# EAGLE schematic FRIDAY_Left_SCH4b (EAGLE 9.6.2)

## Sheet 1 of 5
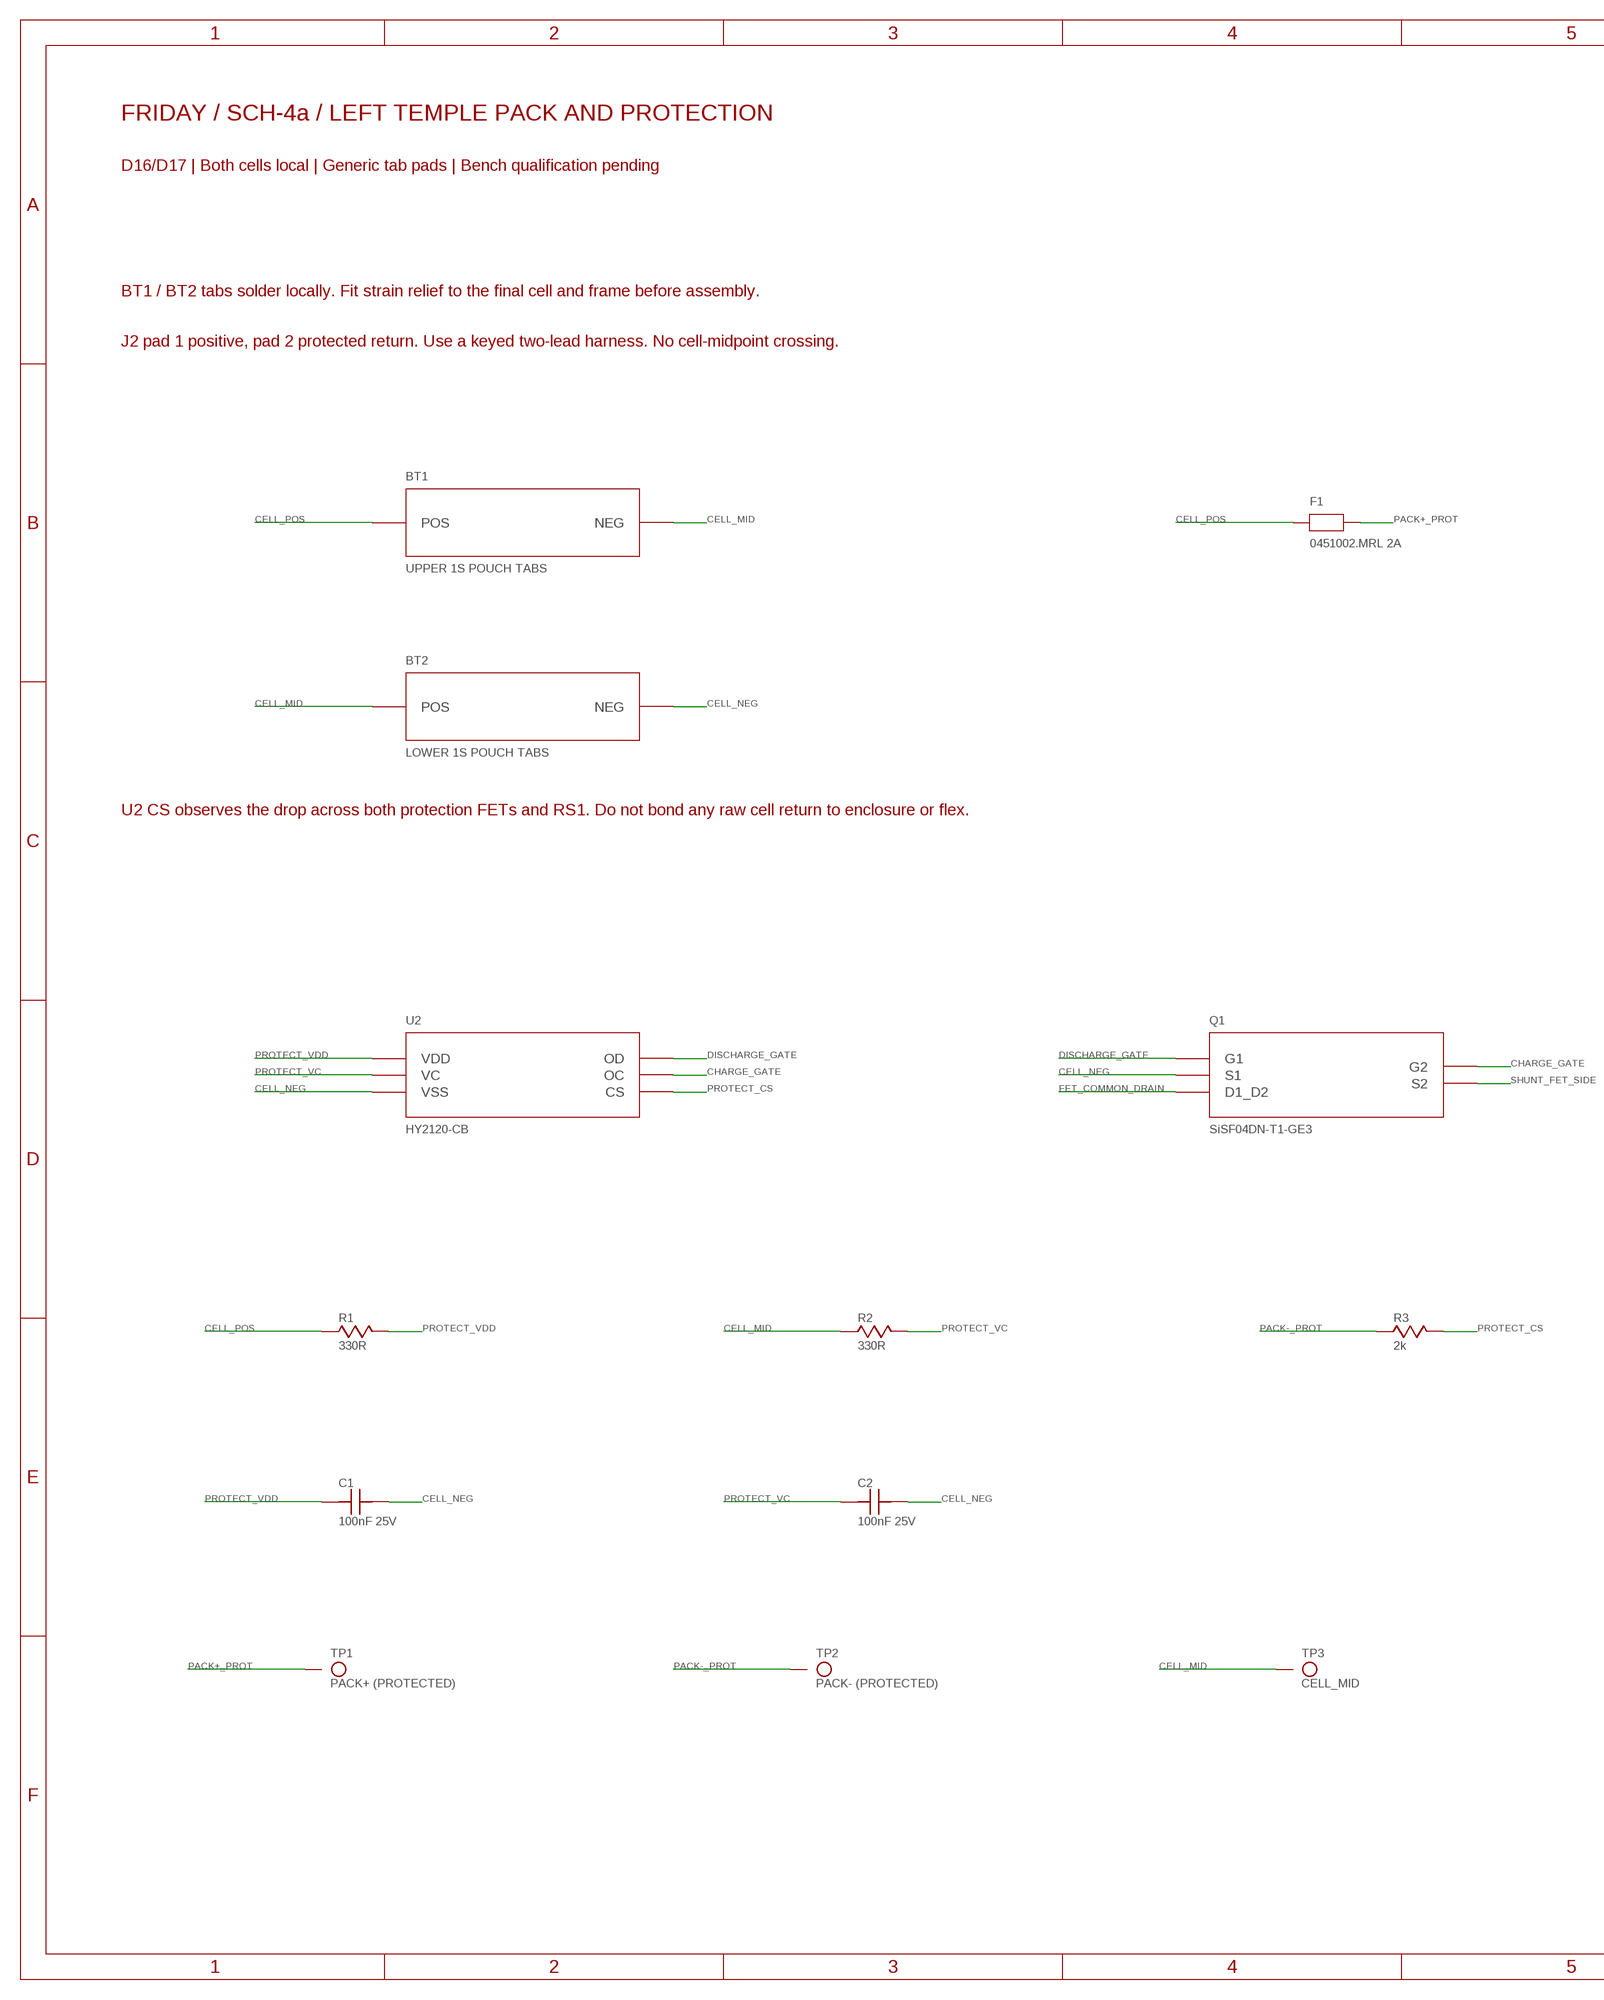
[diagram p0: schematic, sheet 1, part 1 of 2]
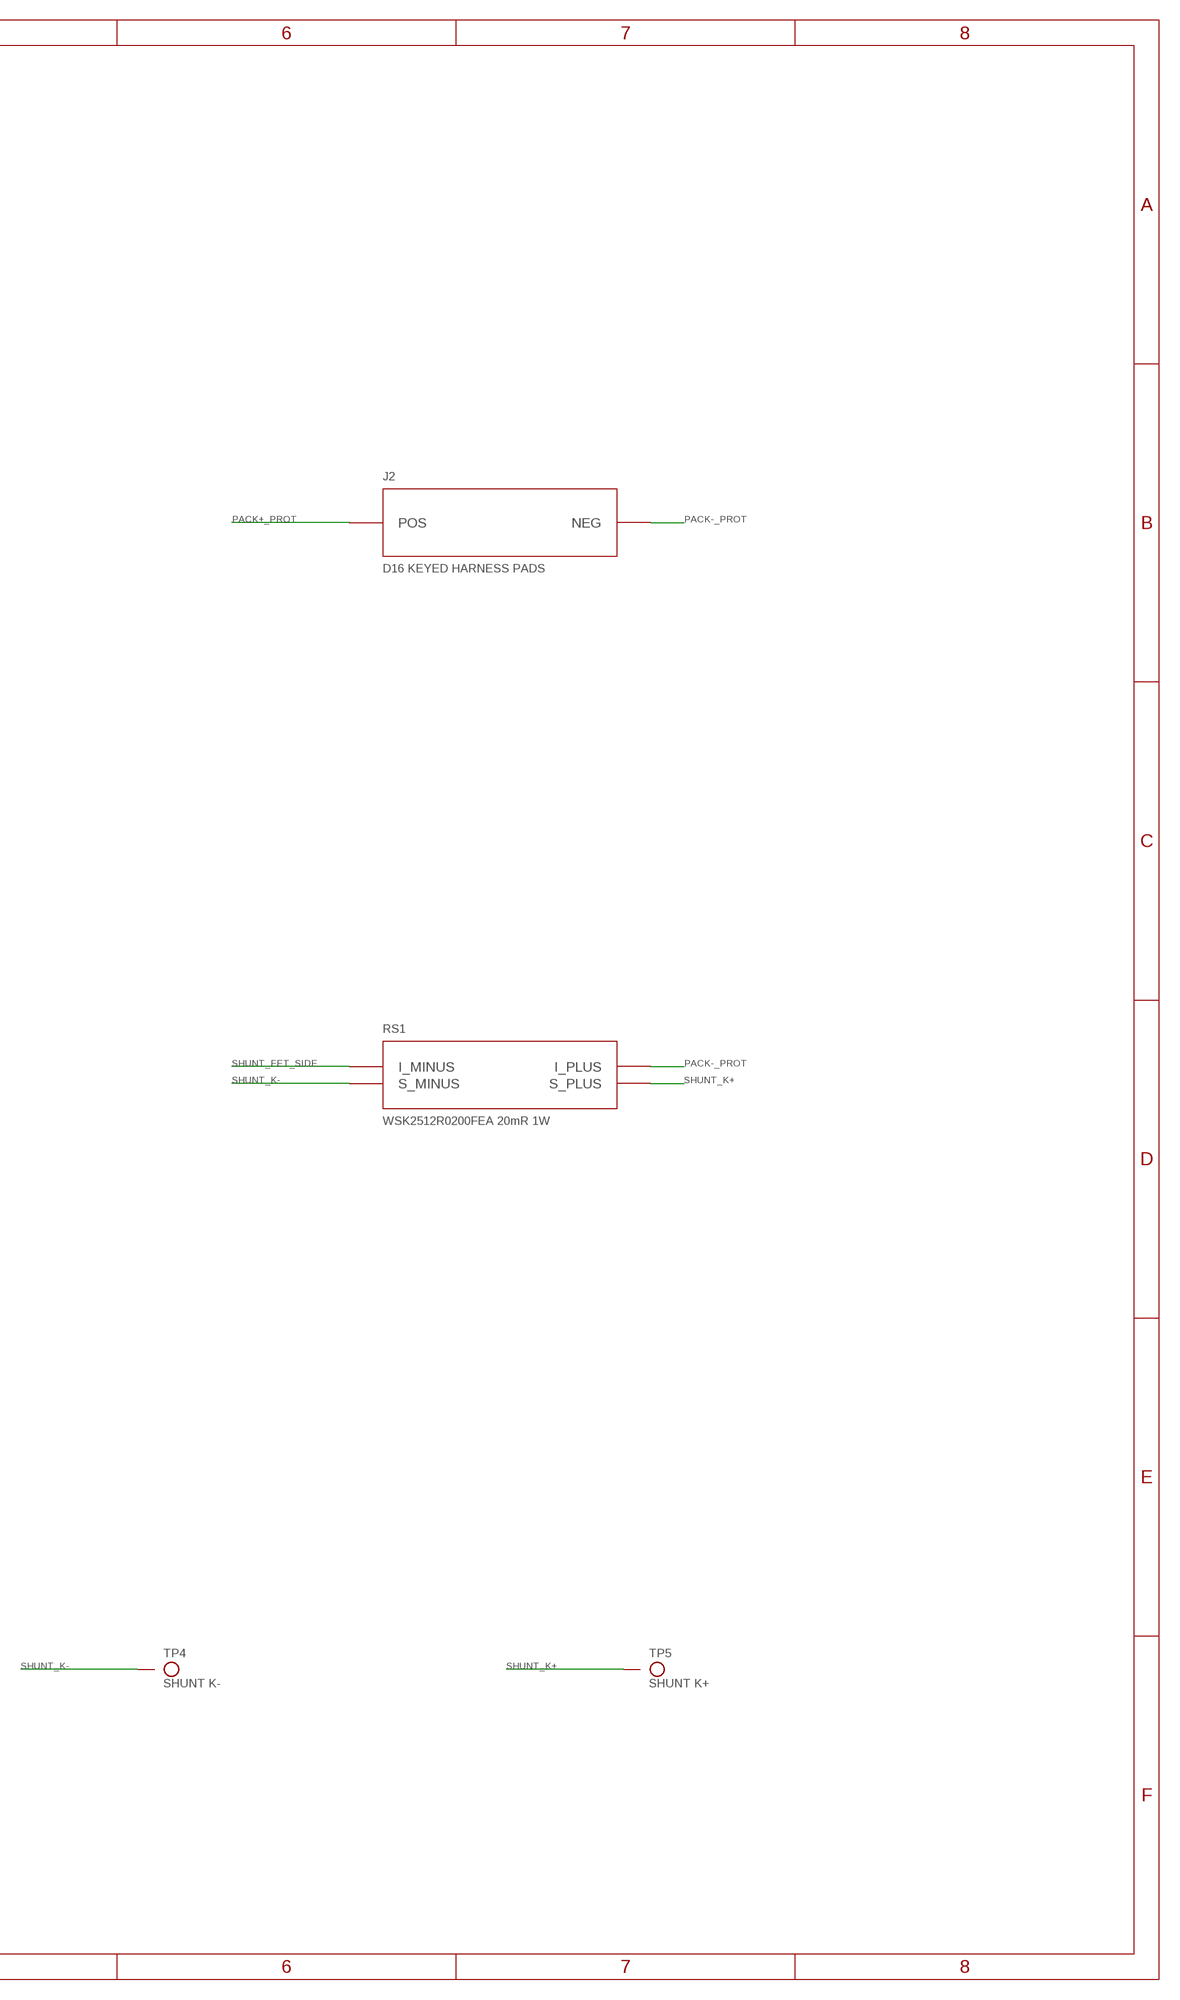
[diagram p1: schematic, sheet 1, part 2 of 2]

### Parts
BT1  UPPER 1S POUCH TABS  CELL_TABS  [CELL_TABS]
BT2  LOWER 1S POUCH TABS  CELL_TABS  [CELL_TABS]
C1  100nF 25V  C_0603  [C0603]
C2  100nF 25V  C_0603  [C0603]
F1  0451002.MRL 2A  NANO2_FUSE  [NANO2_2410]
J2  D16 KEYED HARNESS PADS  HARNESS_PADS  [HARNESS_PADS]
Q1  SiSF04DN-T1-GE3  SISF04DN  [POWERPAK_1212_8SCD]
R1  330R  R_0603  [R0603]
R2  330R  R_0603  [R0603]
R3  2k  R_0603  [R0603]
RS1  WSK2512R0200FEA 20mR 1W  WSK2512  [VISHAY_WSK2512]
TP1  PACK+ (PROTECTED)  TP_1MM  [TP_1MM]
TP2  PACK- (PROTECTED)  TP_1MM  [TP_1MM]
TP3  CELL_MID  TP_1MM  [TP_1MM]
TP4  SHUNT K-  TP_1MM  [TP_1MM]
TP5  SHUNT K+  TP_1MM  [TP_1MM]
U2  HY2120-CB  HY2120_CB  [SOT23_6]

### Nets
CELL_MID: BT1.2(NEG) BT2.1(POS) R2.1 TP3.1 ; also sheet 2
CELL_NEG: BT2.2(NEG) C1.2 C2.2 Q1.S1_78(S1) U2.6(VSS)
CELL_POS: BT1.1(POS) F1.1 R1.1
CHARGE_GATE: Q1.4(G2) U2.2(OC)
DISCHARGE_GATE: Q1.1(G1) U2.1(OD)
FET_COMMON_DRAIN: Q1.2(D1_D2) Q1.3(D1_D2)
PACK+_PROT: F1.2 J2.1(POS) TP1.1 ; also sheet 2
PACK-_PROT: J2.2(NEG) R3.1 RS1.P2(I_PLUS) TP2.1 ; also sheet 2,3,4,5
PROTECT_CS: R3.2 U2.3(CS)
PROTECT_VC: C2.1 R2.2 U2.4(VC)
PROTECT_VDD: C1.1 R1.2 U2.5(VDD)
SHUNT_FET_SIDE: Q1.S2_56(S2) RS1.P1(I_MINUS)
SHUNT_K+: RS1.K2(S_PLUS) TP5.1
SHUNT_K-: RS1.K1(S_MINUS) TP4.1

### Notes on the sheet
- FRIDAY / SCH-4a / LEFT TEMPLE PACK AND PROTECTION
- D16/D17 | Both cells local | Generic tab pads | Bench qualification pending
- BT1 / BT2 tabs solder locally. Fit strain relief to the final cell and frame before assembly.
- J2 pad 1 positive, pad 2 protected return. Use a keyed two-lead harness. No cell-midpoint crossing.
- U2 CS observes the drop across both protection FETs and RS1. Do not bond any raw cell return to enclosure or flex.

## Sheet 2 of 5
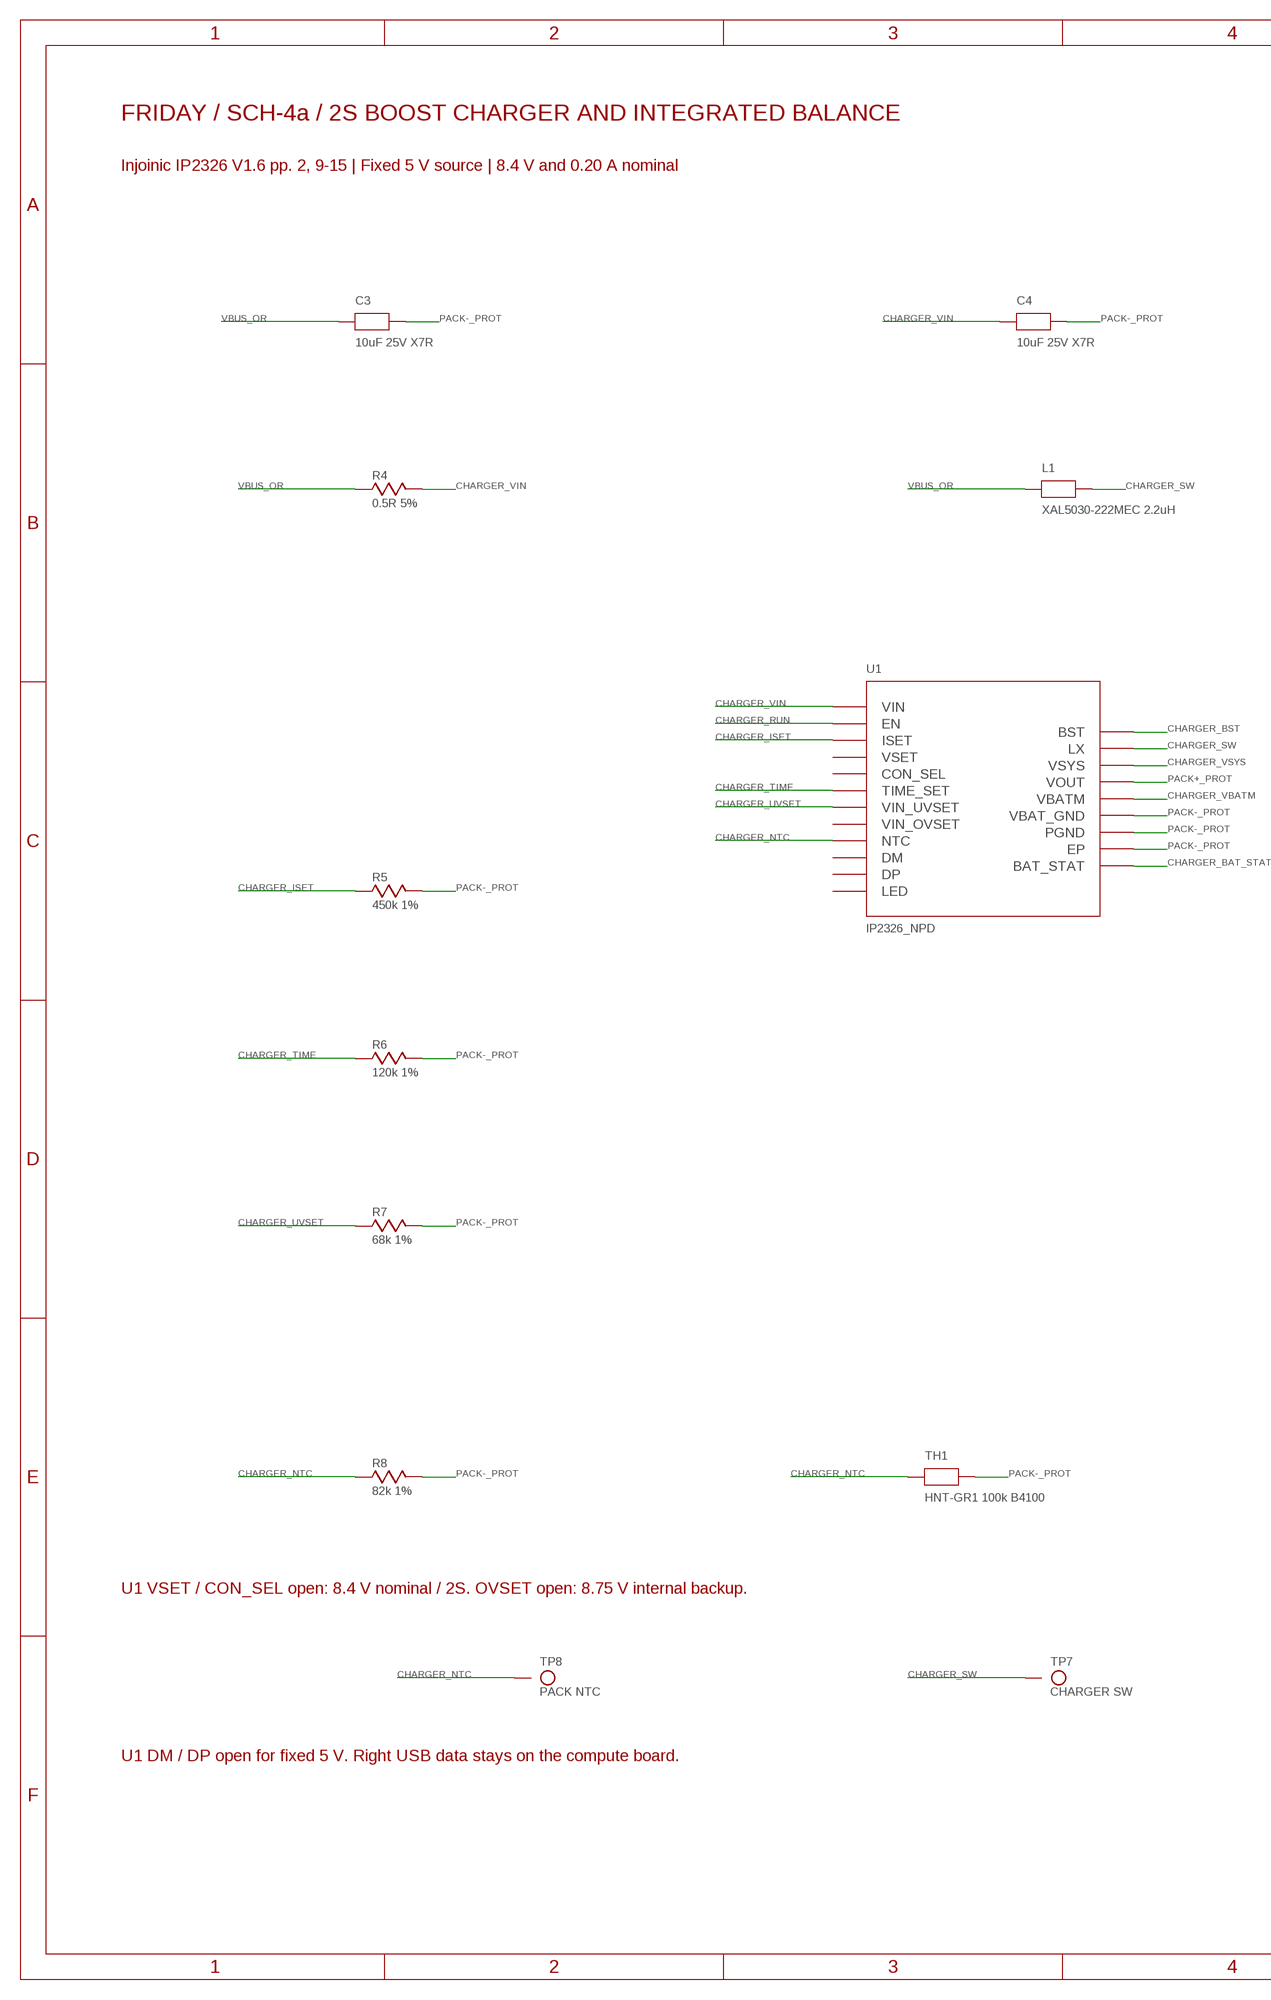
[diagram p2: schematic, sheet 2, part 1 of 2]
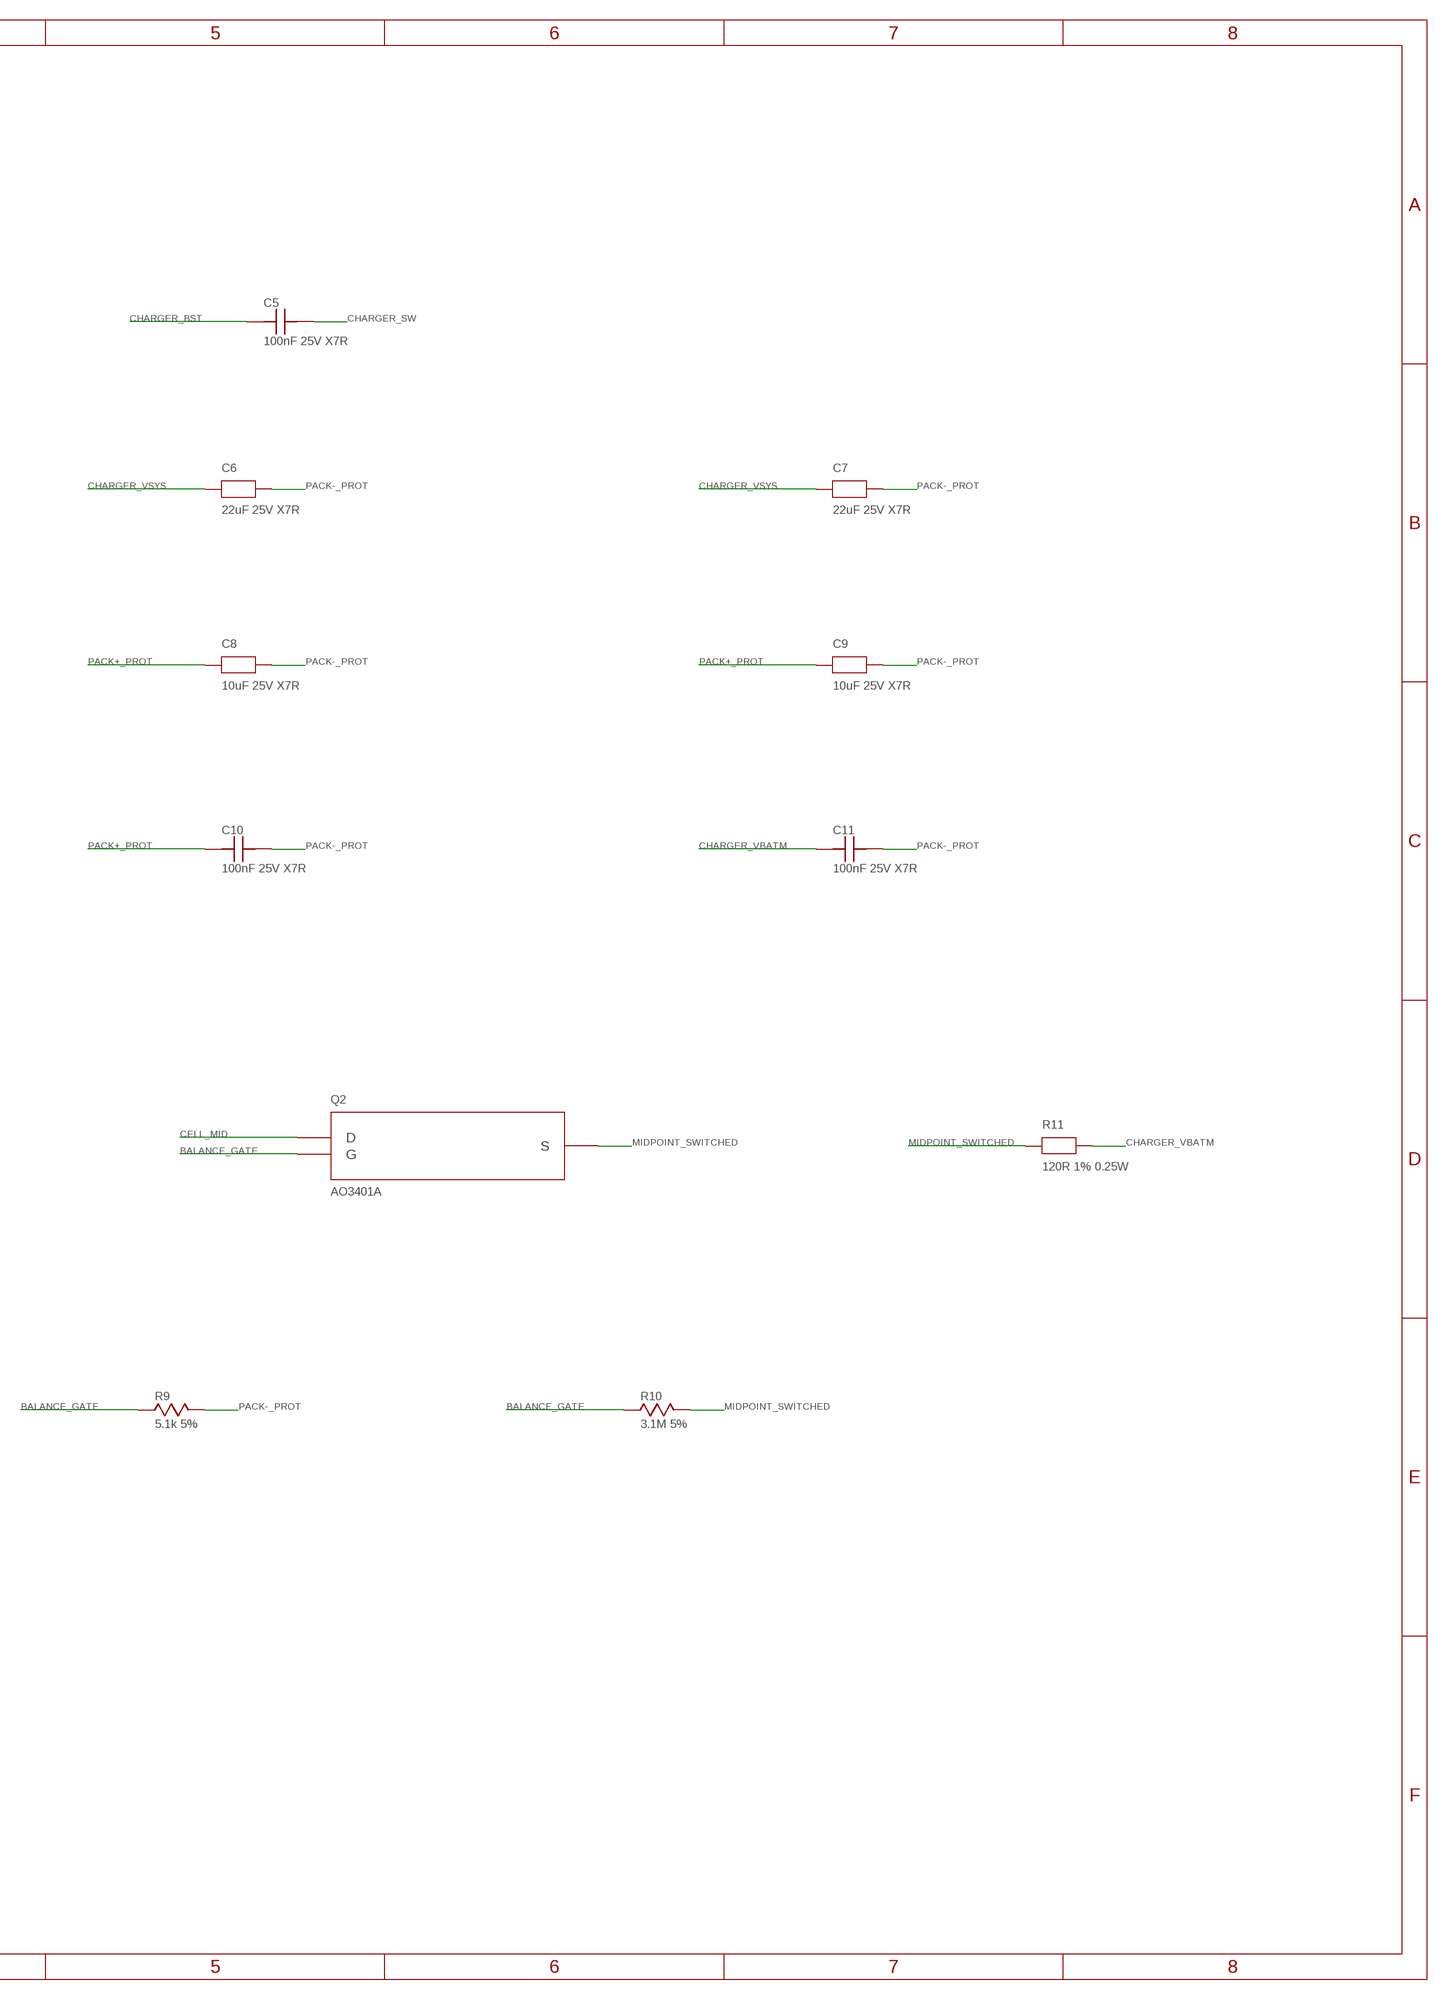
[diagram p3: schematic, sheet 2, part 2 of 2]

### Parts
C3  10uF 25V X7R  C_1206  [C_1206]
C4  10uF 25V X7R  C_1206  [C_1206]
C5  100nF 25V X7R  C_0603  [C0603]
C6  22uF 25V X7R  C_1206  [C_1206]
C7  22uF 25V X7R  C_1206  [C_1206]
C8  10uF 25V X7R  C_1206  [C_1206]
C9  10uF 25V X7R  C_1206  [C_1206]
C10  100nF 25V X7R  C_0603  [C0603]
C11  100nF 25V X7R  C_0603  [C0603]
L1  XAL5030-222MEC 2.2uH  INDUCTOR  [XAL5030]
Q2  AO3401A  [SOT23_3]
R4  0.5R 5%  R_0603  [R0603]
R5  450k 1%  R_0603  [R0603]
R6  120k 1%  R_0603  [R0603]
R7  68k 1%  R_0603  [R0603]
R8  82k 1%  R_0603  [R0603]
R9  5.1k 5%  R_0603  [R0603]
R10  3.1M 5%  R_0603  [R0603]
R11  120R 1% 0.25W  R_1206  [C_1206]
TH1  HNT-GR1 100k B4100  PACK_NTC  [NTC_PADS]
TP7  CHARGER SW  TP_1MM  [TP_1MM]
TP8  PACK NTC  TP_1MM  [TP_1MM]
U1  IP2326_NPD  [QFN24_4X4_EP]

### Nets
BALANCE_GATE: Q2.1(G) R9.1 R10.1
CELL_MID: Q2.3(D) ; also sheet 1
CHARGER_BAT_STAT: U1.5(BAT_STAT) ; also sheet 4
CHARGER_BST: C5.1 U1.14(BST)
CHARGER_ISET: R5.1 U1.11(ISET)
CHARGER_NTC: R8.1 TH1.1 TP8.1 U1.4(NTC)
CHARGER_RUN: U1.12(EN) ; also sheet 4
CHARGER_SW: C5.2 L1.2 TP7.1 U1.15(LX) U1.16(LX) U1.17(LX)
CHARGER_TIME: R6.1 U1.7(TIME_SET)
CHARGER_UVSET: R7.1 U1.8(VIN_UVSET)
CHARGER_VBATM: C11.1 R11.2 U1.23(VBATM)
CHARGER_VIN: C4.1 R4.2 U1.13(VIN)
CHARGER_VSYS: C6.1 C7.1 U1.19(VSYS) U1.20(VSYS)
MIDPOINT_SWITCHED: Q2.2(S) R10.2 R11.1
PACK+_PROT: C8.1 C9.1 C10.1 U1.21(VOUT) U1.22(VOUT) ; also sheet 1
PACK-_PROT: C3.2 C4.2 C6.2 C7.2 C8.2 C9.2 C10.2 C11.2 R5.2 R6.2 R7.2 R8.2 R9.2 TH1.2 U1.18(PGND) U1.24(VBAT_GND) U1.EP ; also sheet 1,3,4,5
VBUS_OR: C3.1 L1.1 R4.1 ; also sheet 3,4
Unconnected: U1.1(DM) U1.2(DP) U1.3(VSET) U1.6(LED) U1.9(VIN_OVSET) U1.10(CON_SEL)

### Notes on the sheet
- FRIDAY / SCH-4a / 2S BOOST CHARGER AND INTEGRATED BALANCE
- Injoinic IP2326 V1.6 pp. 2, 9-15 | Fixed 5 V source | 8.4 V and 0.20 A nominal
- U1 VSET / CON_SEL open: 8.4 V nominal / 2S. OVSET open: 8.75 V internal backup.
- U1 DM / DP open for fixed 5 V. Right USB data stays on the compute board.

## Sheet 3 of 5
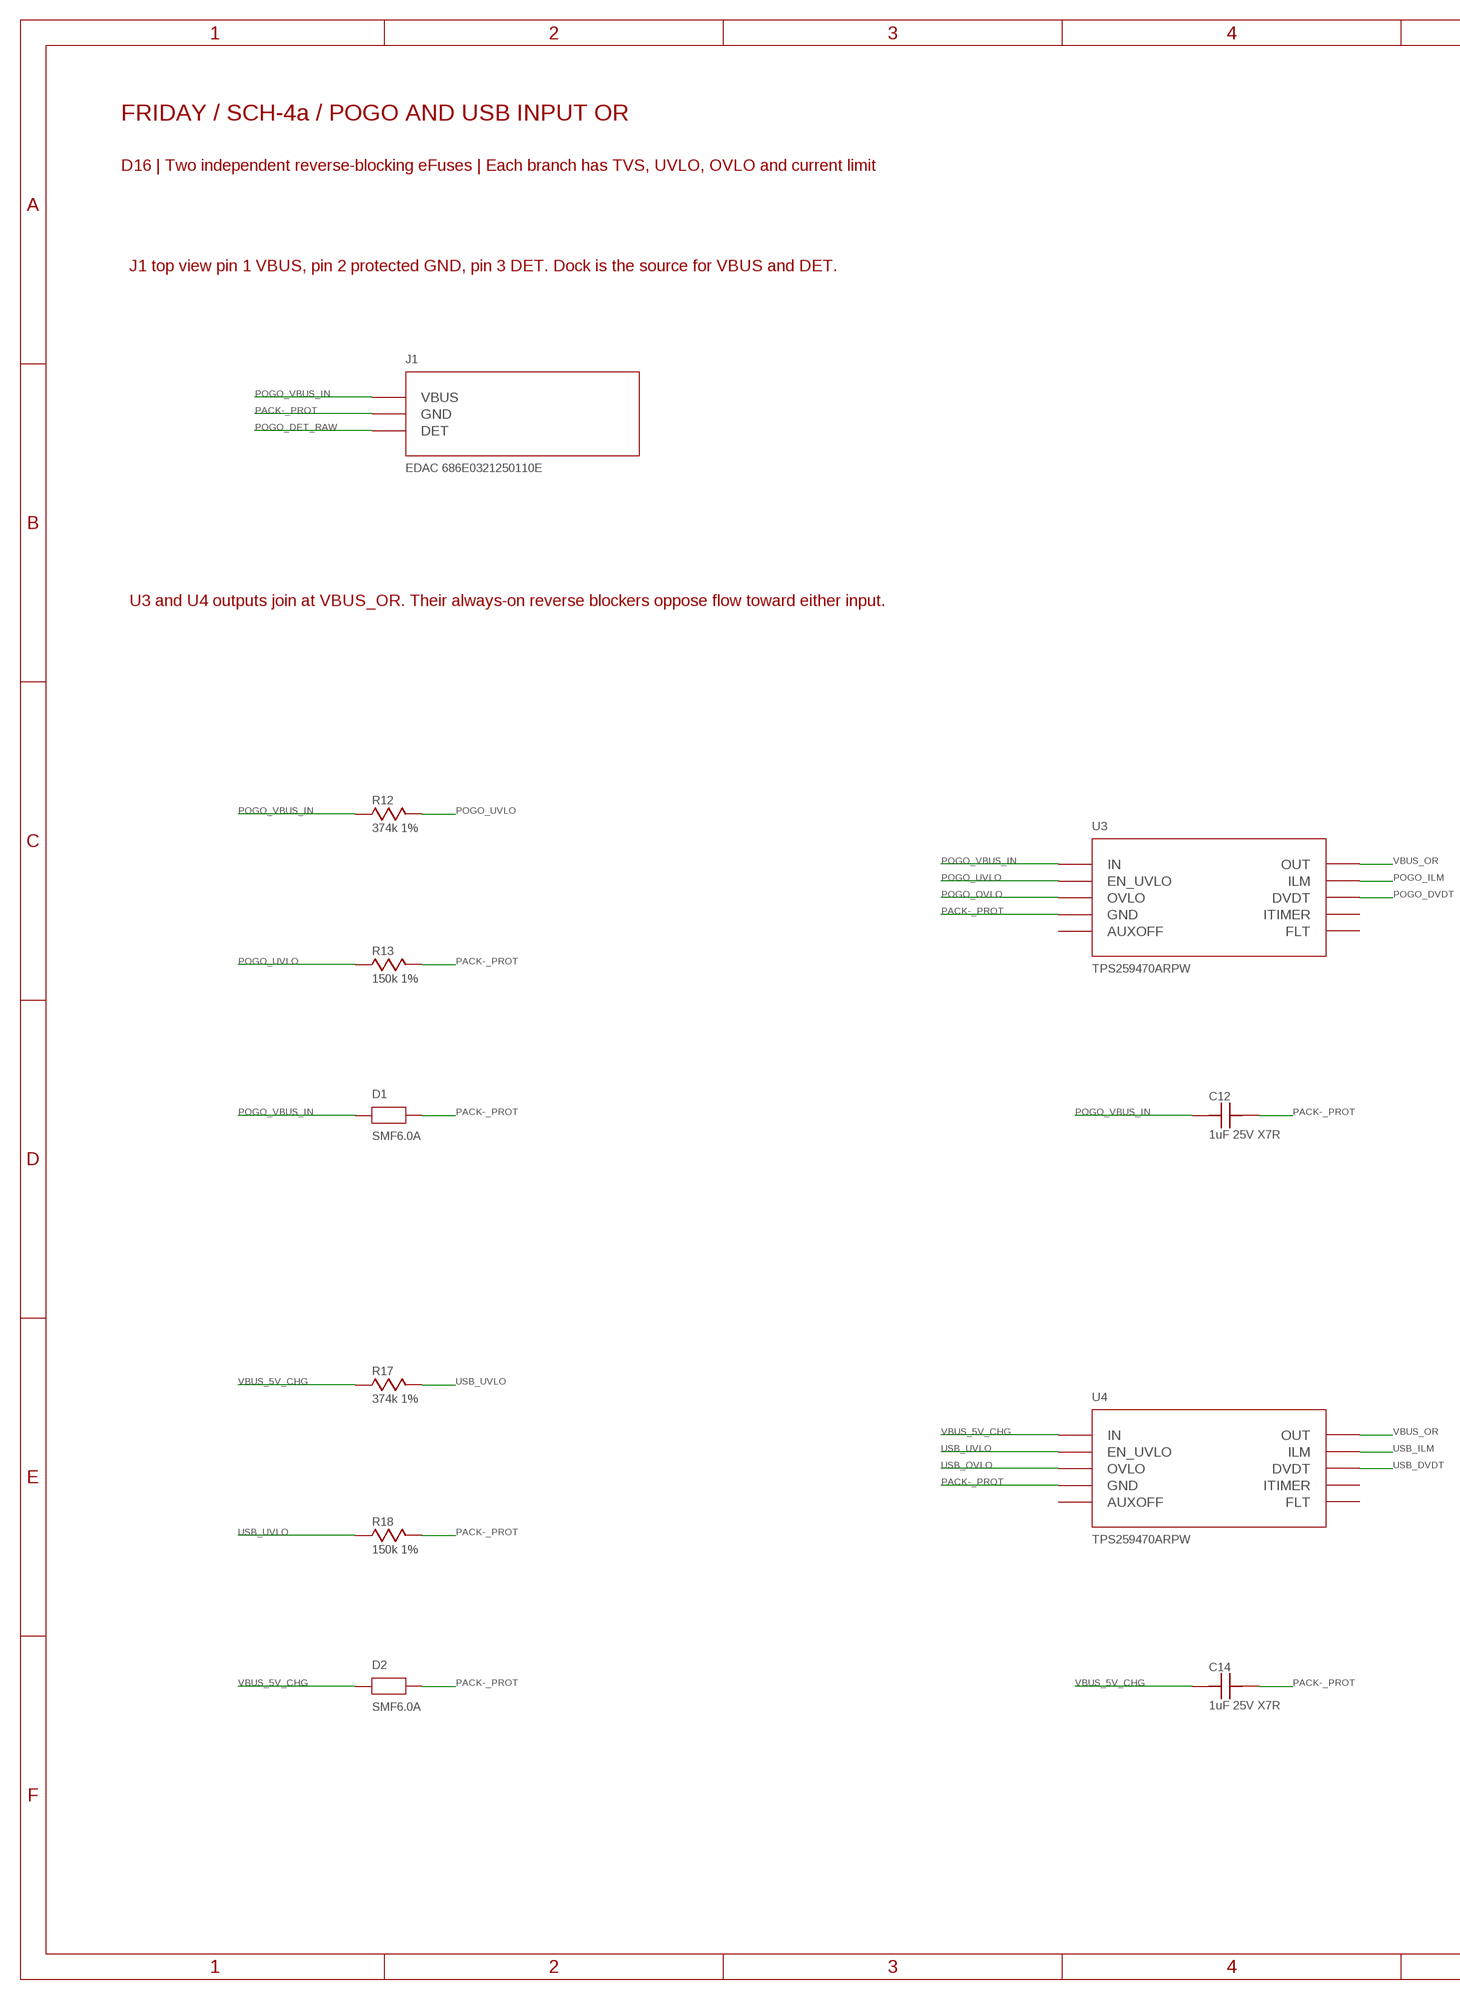
[diagram p4: schematic, sheet 3, part 1 of 2]
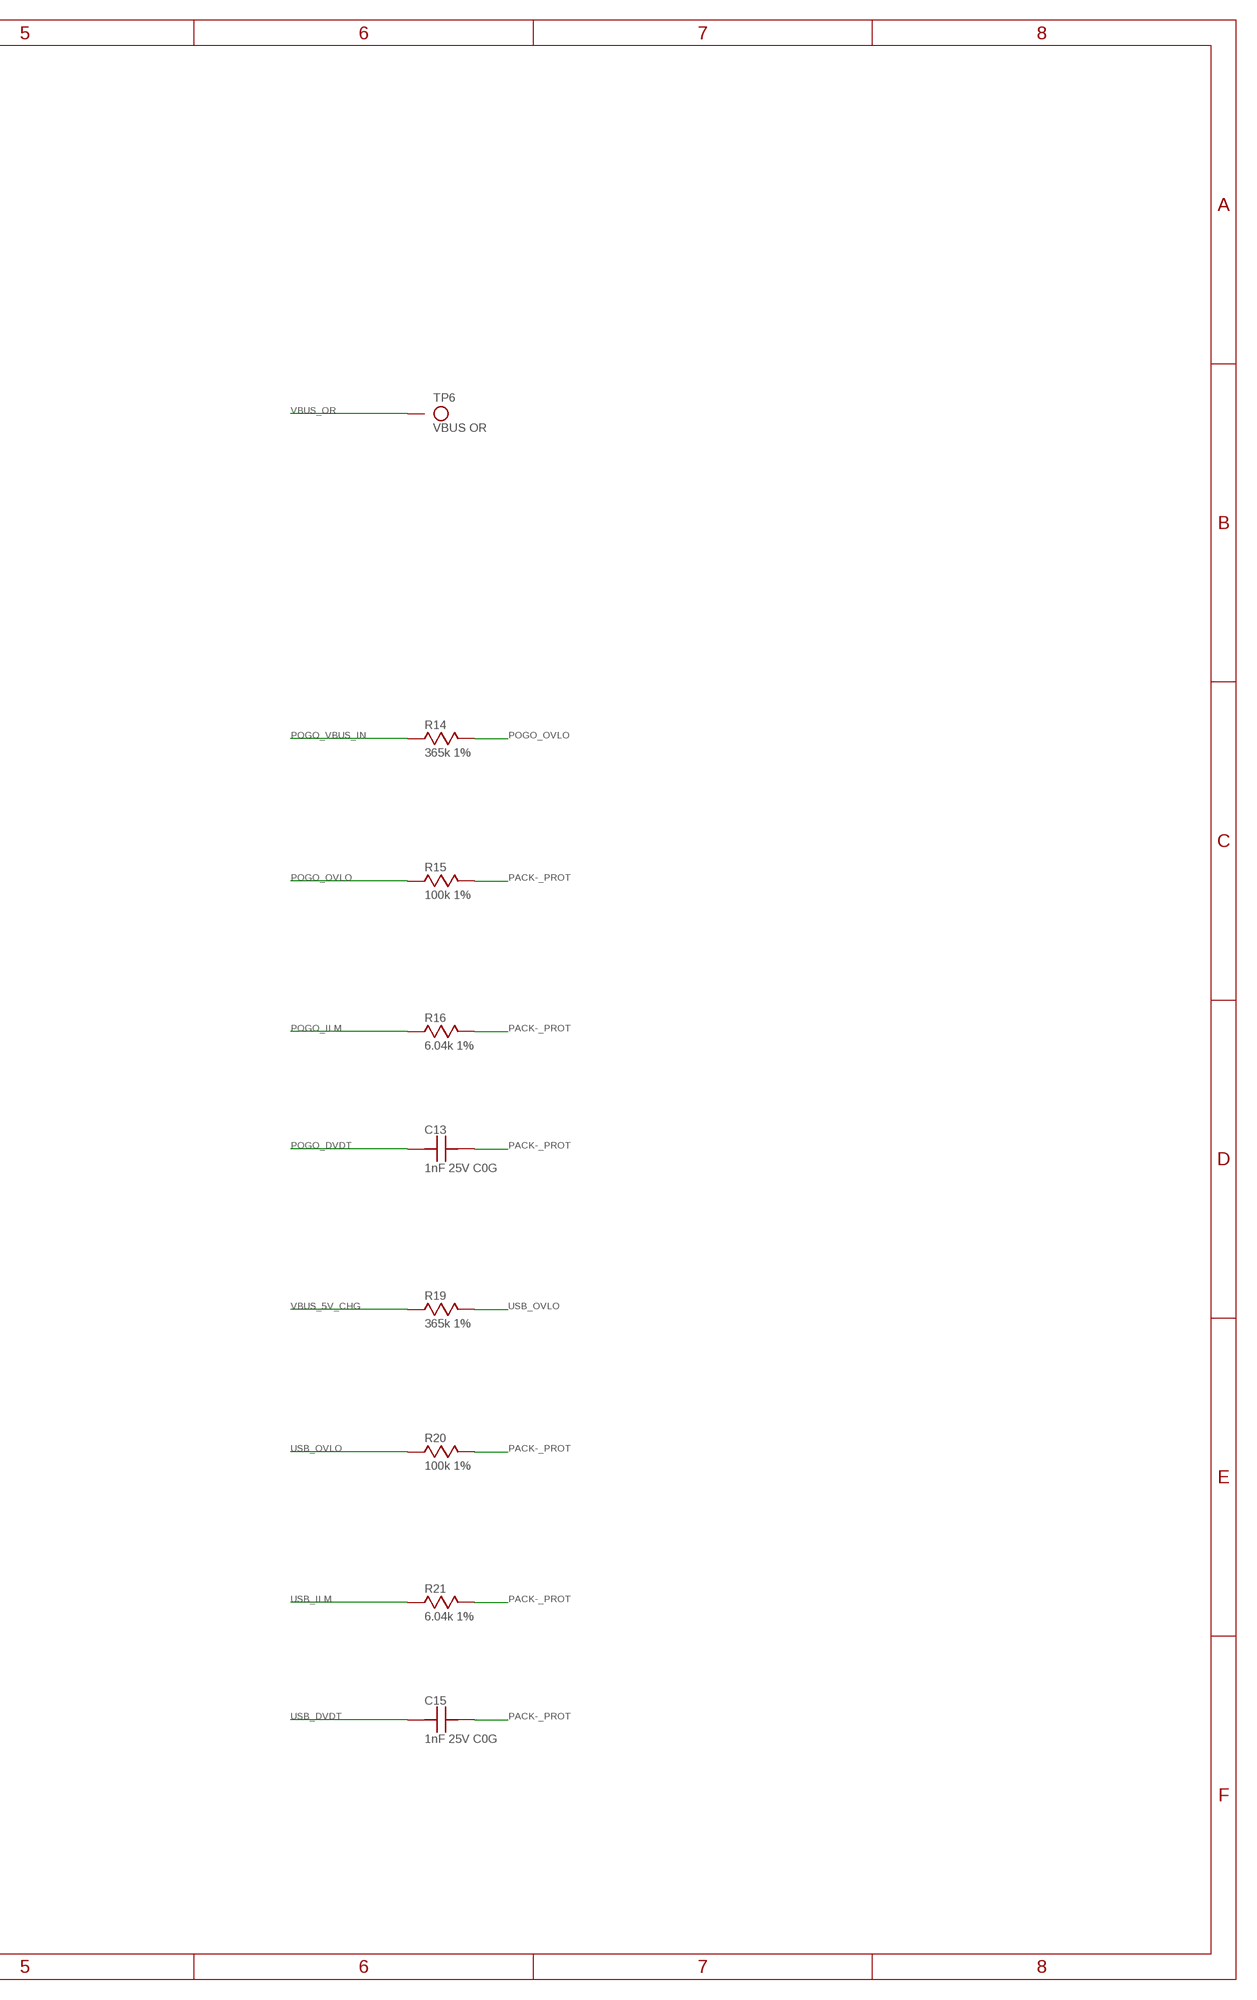
[diagram p5: schematic, sheet 3, part 2 of 2]

### Parts
C12  1uF 25V X7R  C_0603  [C0603]
C13  1nF 25V C0G  C_0603  [C0603]
C14  1uF 25V X7R  C_0603  [C0603]
C15  1nF 25V C0G  C_0603  [C0603]
D1  SMF6.0A  SMF_TVS  [SOD123FL]
D2  SMF6.0A  SMF_TVS  [SOD123FL]
J1  EDAC 686E0321250110E  MAGNETIC_POGO  [EDAC_MAGNETIC_3POS]
R12  374k 1%  R_0603  [R0603]
R13  150k 1%  R_0603  [R0603]
R14  365k 1%  R_0603  [R0603]
R15  100k 1%  R_0603  [R0603]
R16  6.04k 1%  R_0603  [R0603]
R17  374k 1%  R_0603  [R0603]
R18  150k 1%  R_0603  [R0603]
R19  365k 1%  R_0603  [R0603]
R20  100k 1%  R_0603  [R0603]
R21  6.04k 1%  R_0603  [R0603]
TP6  VBUS OR  TP_1MM  [TP_1MM]
U3  TPS259470ARPW  TPS259470  [TI_RPW0010A]
U4  TPS259470ARPW  TPS259470  [TI_RPW0010A]

### Nets
PACK-_PROT: C12.2 C13.2 C14.2 C15.2 D1.2(A) D2.2(A) J1.2(GND) R13.2 R15.2 R16.2 R18.2 R20.2 R21.2 U3.8(GND) U4.8(GND) ; also sheet 1,2,4,5
POGO_DET_RAW: J1.3(DET) ; also sheet 4
POGO_DVDT: C13.1 U3.7(DVDT)
POGO_ILM: R16.1 U3.9(ILM)
POGO_OVLO: R14.2 R15.1 U3.2(OVLO)
POGO_UVLO: R12.2 R13.1 U3.1(EN_UVLO)
POGO_VBUS_IN: C12.1 D1.1(K) J1.1(VBUS) R12.1 R14.1 U3.5(IN)
USB_DVDT: C15.1 U4.7(DVDT)
USB_ILM: R21.1 U4.9(ILM)
USB_OVLO: R19.2 R20.1 U4.2(OVLO)
USB_UVLO: R17.2 R18.1 U4.1(EN_UVLO)
VBUS_5V_CHG: C14.1 D2.1(K) R17.1 R19.1 U4.5(IN) ; also sheet 4
VBUS_OR: TP6.1 U3.6(OUT) U4.6(OUT) ; also sheet 2,4
Unconnected: U3.3(AUXOFF) U3.4(FLT) U3.10(ITIMER) U4.3(AUXOFF) U4.4(FLT) U4.10(ITIMER)

### Notes on the sheet
- FRIDAY / SCH-4a / POGO AND USB INPUT OR
- D16 | Two independent reverse-blocking eFuses | Each branch has TVS, UVLO, OVLO and current limit
- J1 top view pin 1 VBUS, pin 2 protected GND, pin 3 DET. Dock is the source for VBUS and DET.
- U3 and U4 outputs join at VBUS_OR. Their always-on reverse blockers oppose flow toward either input.

## Sheet 4 of 5
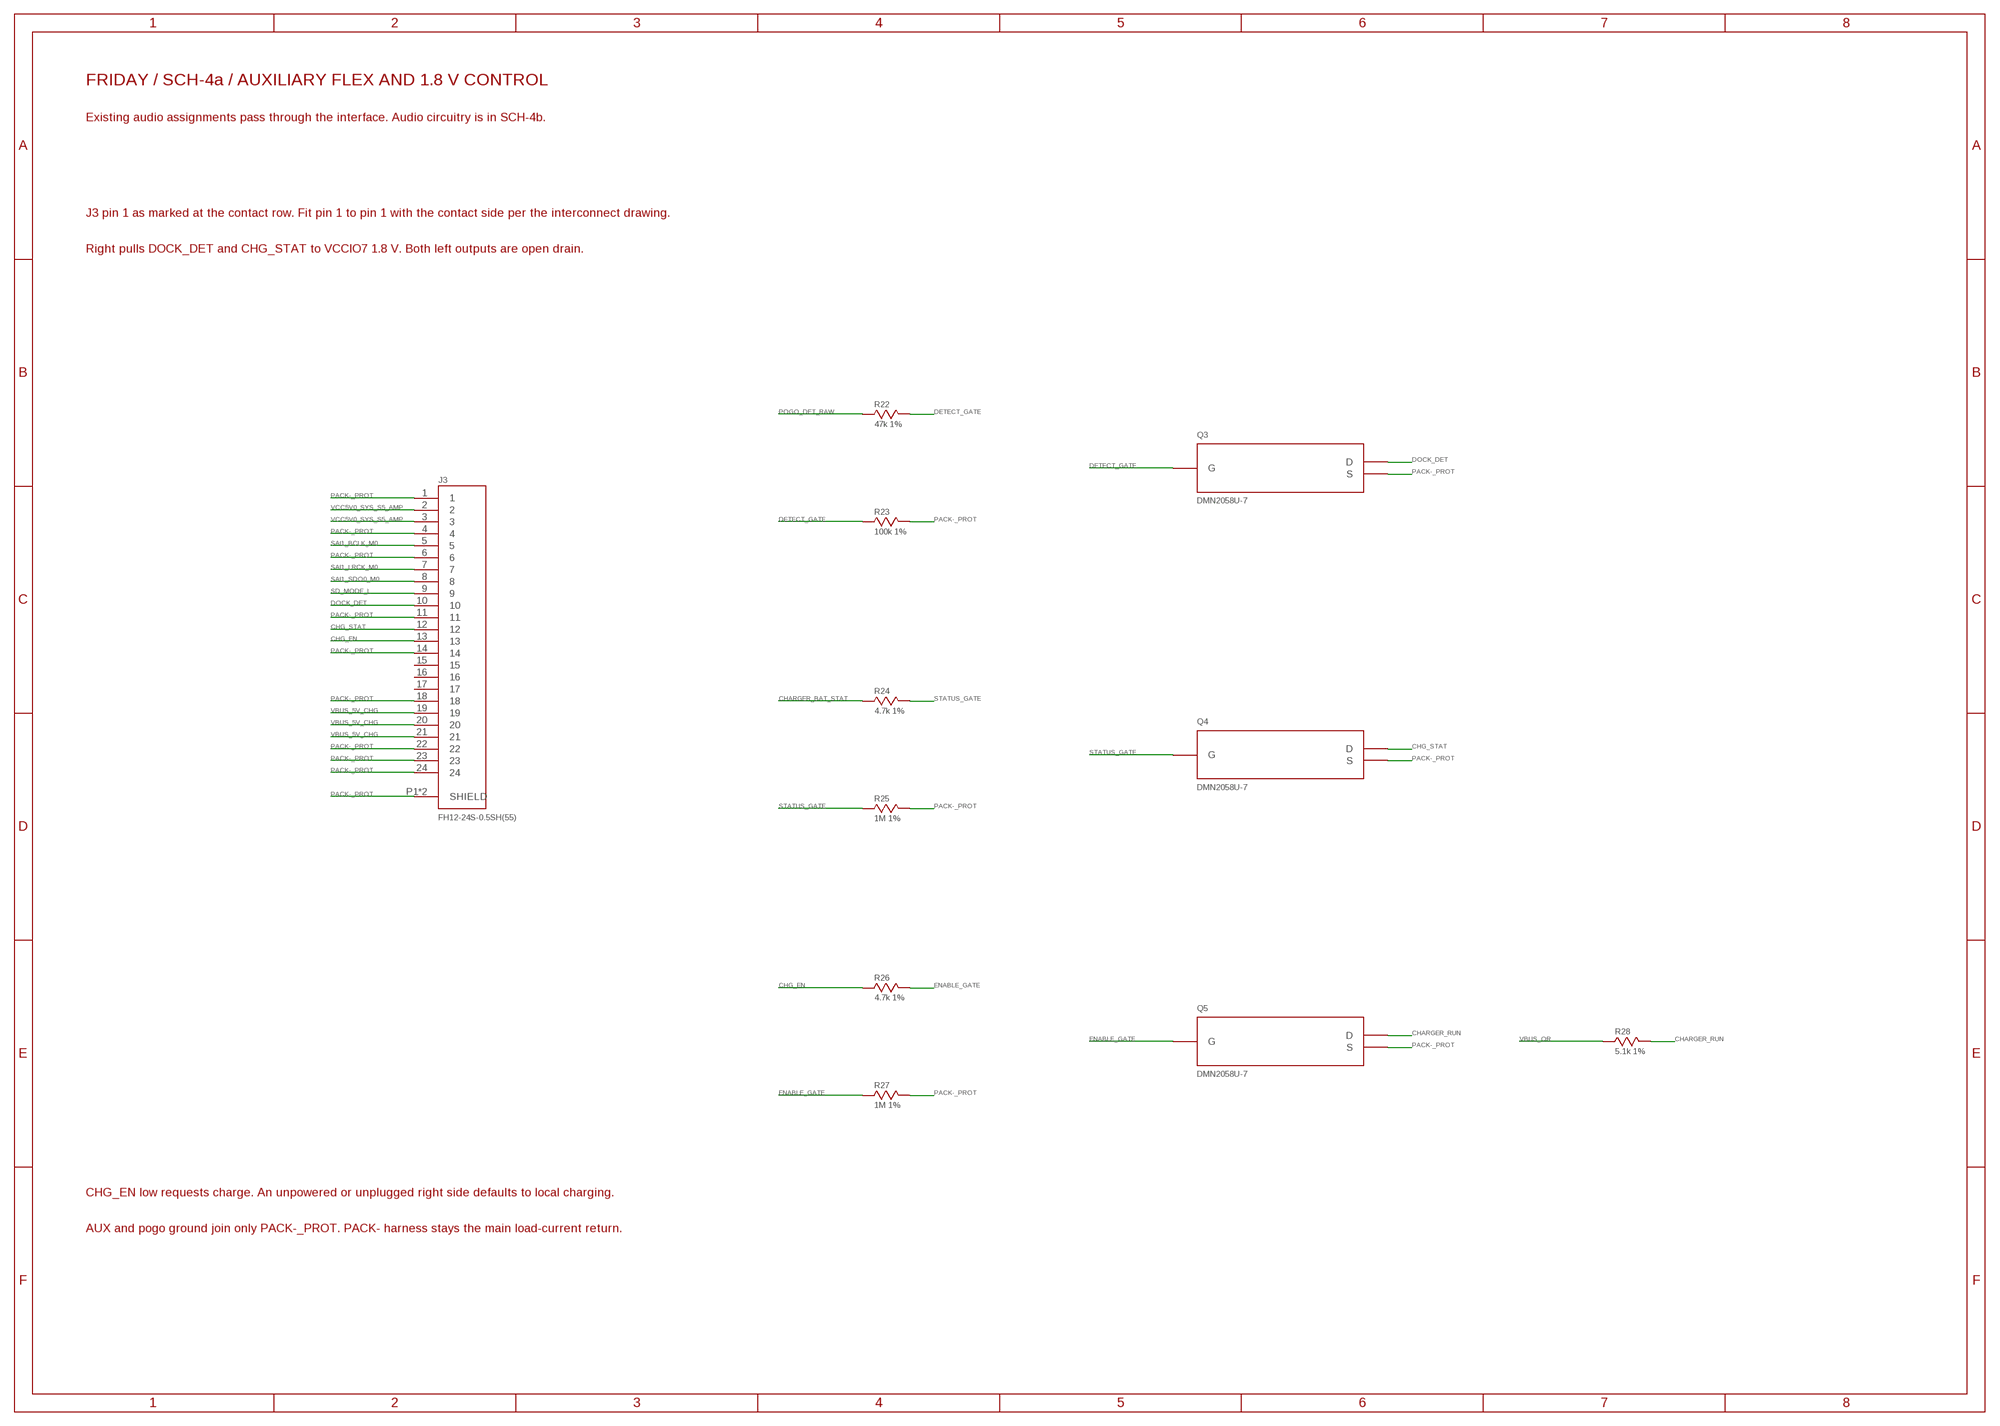
[diagram p6: schematic, sheet 4]

### Parts
J3  FH12-24S-0.5SH(55)  [HRS_FH12-24S-0.5SH(55)]
Q3  DMN2058U-7  DMN2058U  [DIODES_SOT23]
Q4  DMN2058U-7  DMN2058U  [DIODES_SOT23]
Q5  DMN2058U-7  DMN2058U  [DIODES_SOT23]
R22  47k 1%  R_0603  [R0603]
R23  100k 1%  R_0603  [R0603]
R24  4.7k 1%  R_0603  [R0603]
R25  1M 1%  R_0603  [R0603]
R26  4.7k 1%  R_0603  [R0603]
R27  1M 1%  R_0603  [R0603]
R28  5.1k 1%  R_0603  [R0603]

### Nets
CHARGER_BAT_STAT: R24.1 ; also sheet 2
CHARGER_RUN: Q5.3(D) R28.2 ; also sheet 2
CHG_EN: J3.13 R26.1
CHG_STAT: J3.12 Q4.3(D)
DETECT_GATE: Q3.1(G) R22.2 R23.1
DOCK_DET: J3.10 Q3.3(D)
ENABLE_GATE: Q5.1(G) R26.2 R27.1
PACK-_PROT: J3.1 J3.4 J3.6 J3.11 J3.14 J3.18 J3.22 J3.23 J3.24 J3.P1(SHIELD) J3.P2(SHIELD) Q3.2(S) Q4.2(S) Q5.2(S) R23.2 R25.2 R27.2 ; also sheet 1,2,3,5
POGO_DET_RAW: R22.1 ; also sheet 3
SAI1_BCLK_M0: J3.5 ; also sheet 5
SAI1_LRCK_M0: J3.7 ; also sheet 5
SAI1_SDO0_M0: J3.8 ; also sheet 5
SD_MODE_L: J3.9 ; also sheet 5
STATUS_GATE: Q4.1(G) R24.2 R25.1
VBUS_5V_CHG: J3.19 J3.20 J3.21 ; also sheet 3
VBUS_OR: R28.1 ; also sheet 2,3
VCC5V0_SYS_S5_AMP: J3.2 J3.3 ; also sheet 5
Unconnected: J3.15 J3.16 J3.17

### Notes on the sheet
- FRIDAY / SCH-4a / AUXILIARY FLEX AND 1.8 V CONTROL
- Existing audio assignments pass through the interface. Audio circuitry is in SCH-4b.
- J3 pin 1 as marked at the contact row. Fit pin 1 to pin 1 with the contact side per the interconnect drawing.
- Right pulls DOCK_DET and CHG_STAT to VCCIO7 1.8 V. Both left outputs are open drain.
- CHG_EN low requests charge. An unpowered or unplugged right side defaults to local charging.
- AUX and pogo ground join only PACK-_PROT. PACK- harness stays the main load-current return.

## Sheet 5 of 5
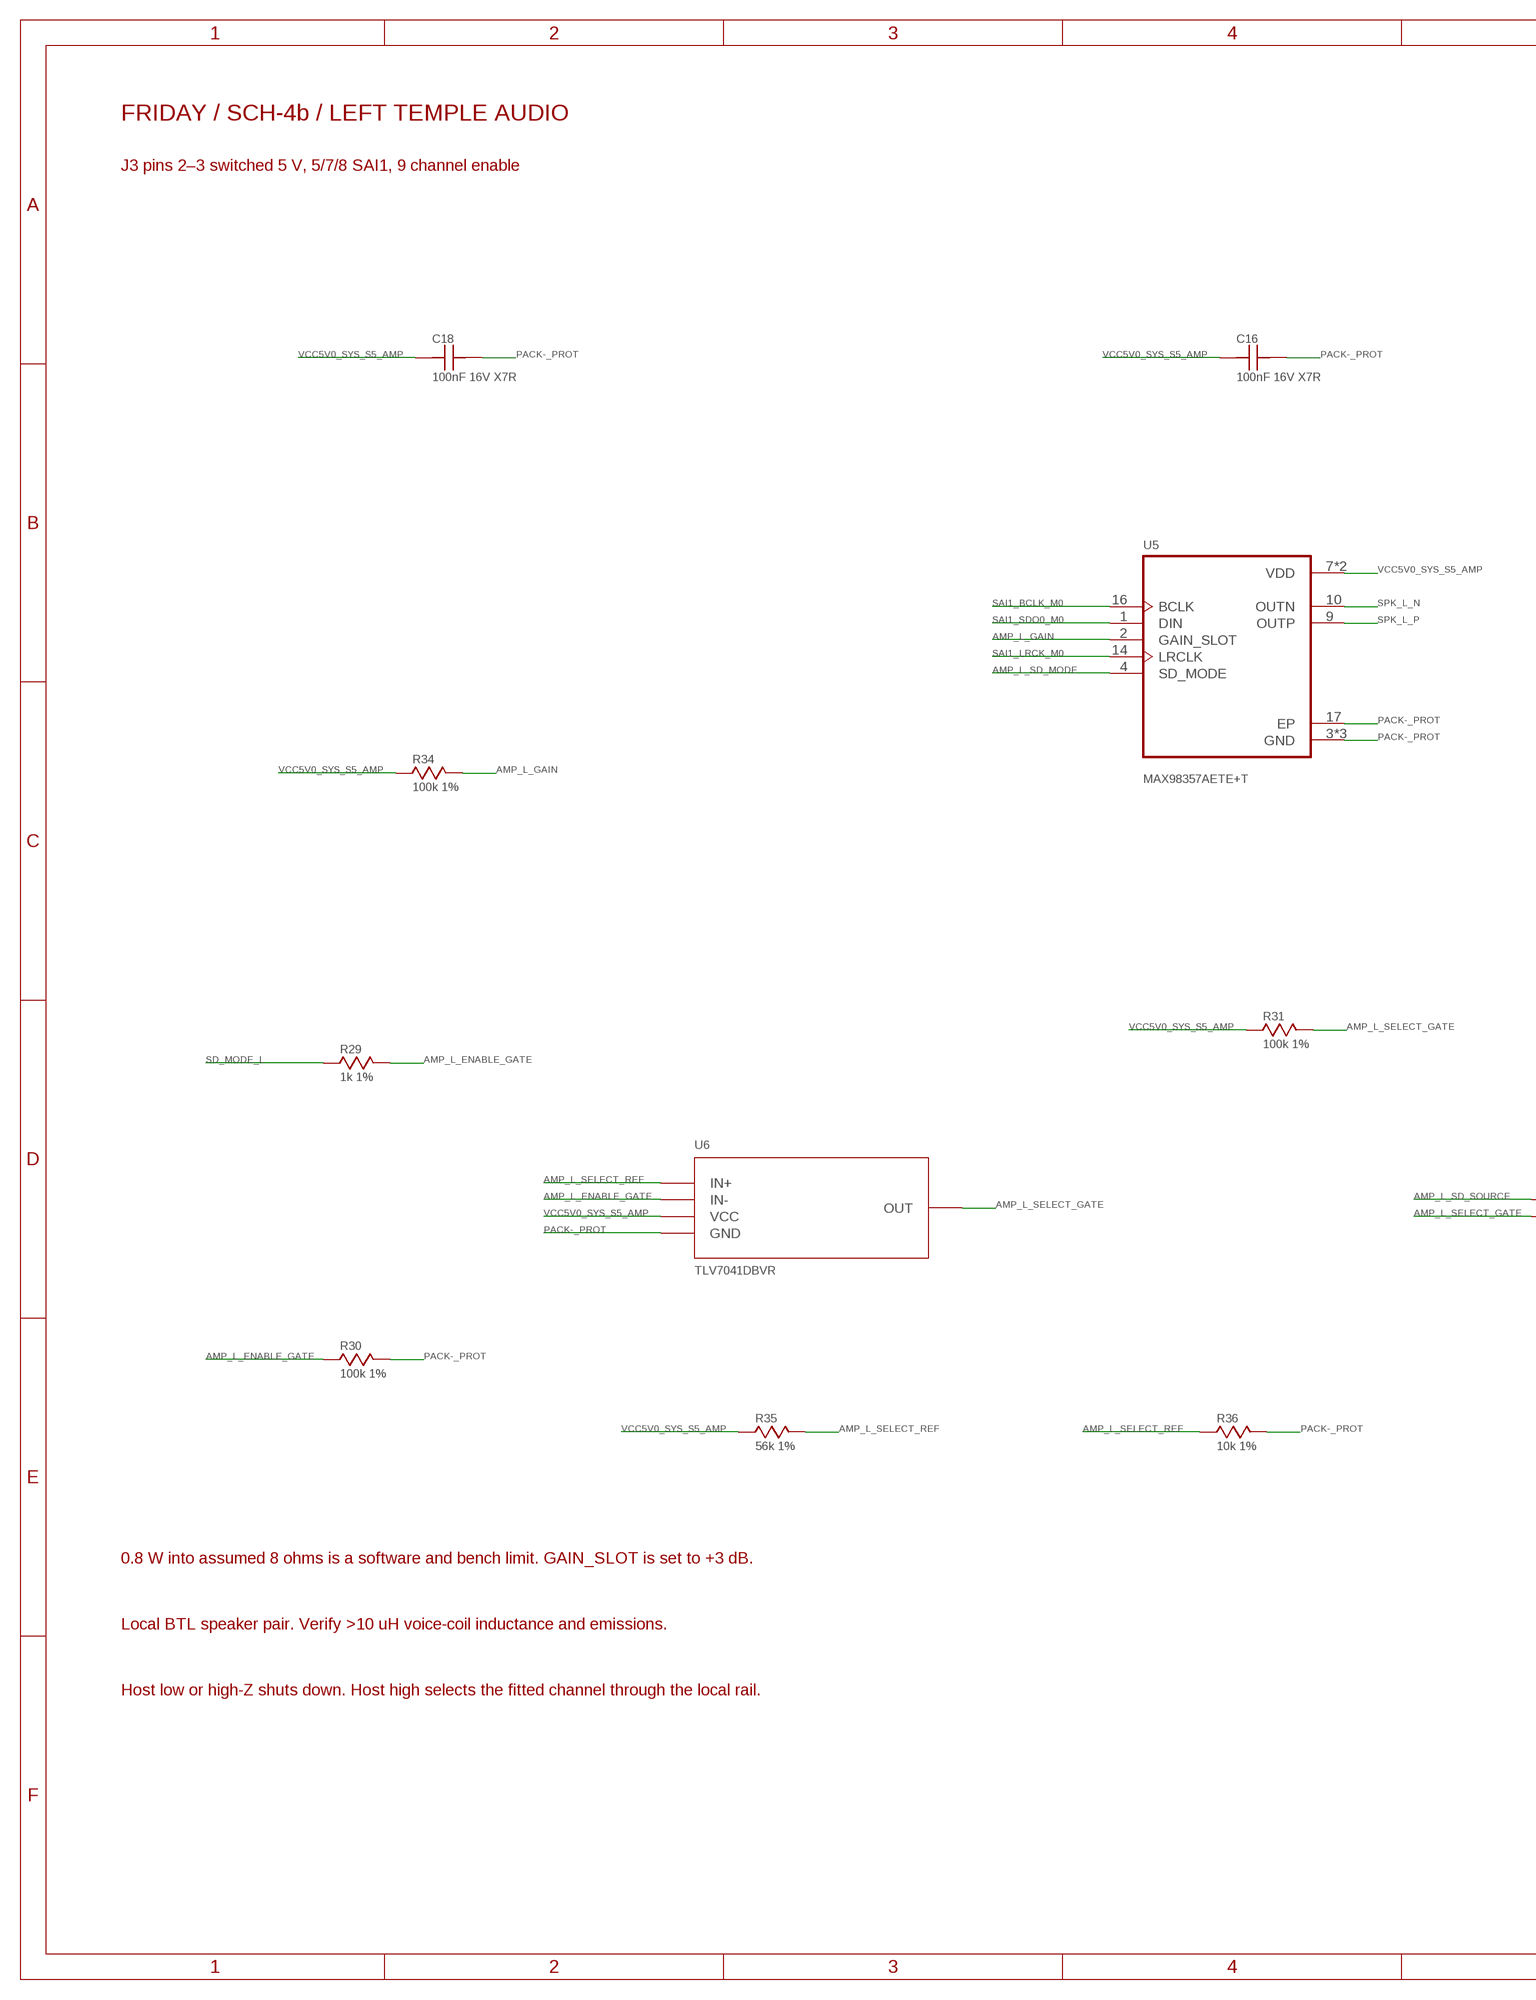
[diagram p7: schematic, sheet 5, part 1 of 2]
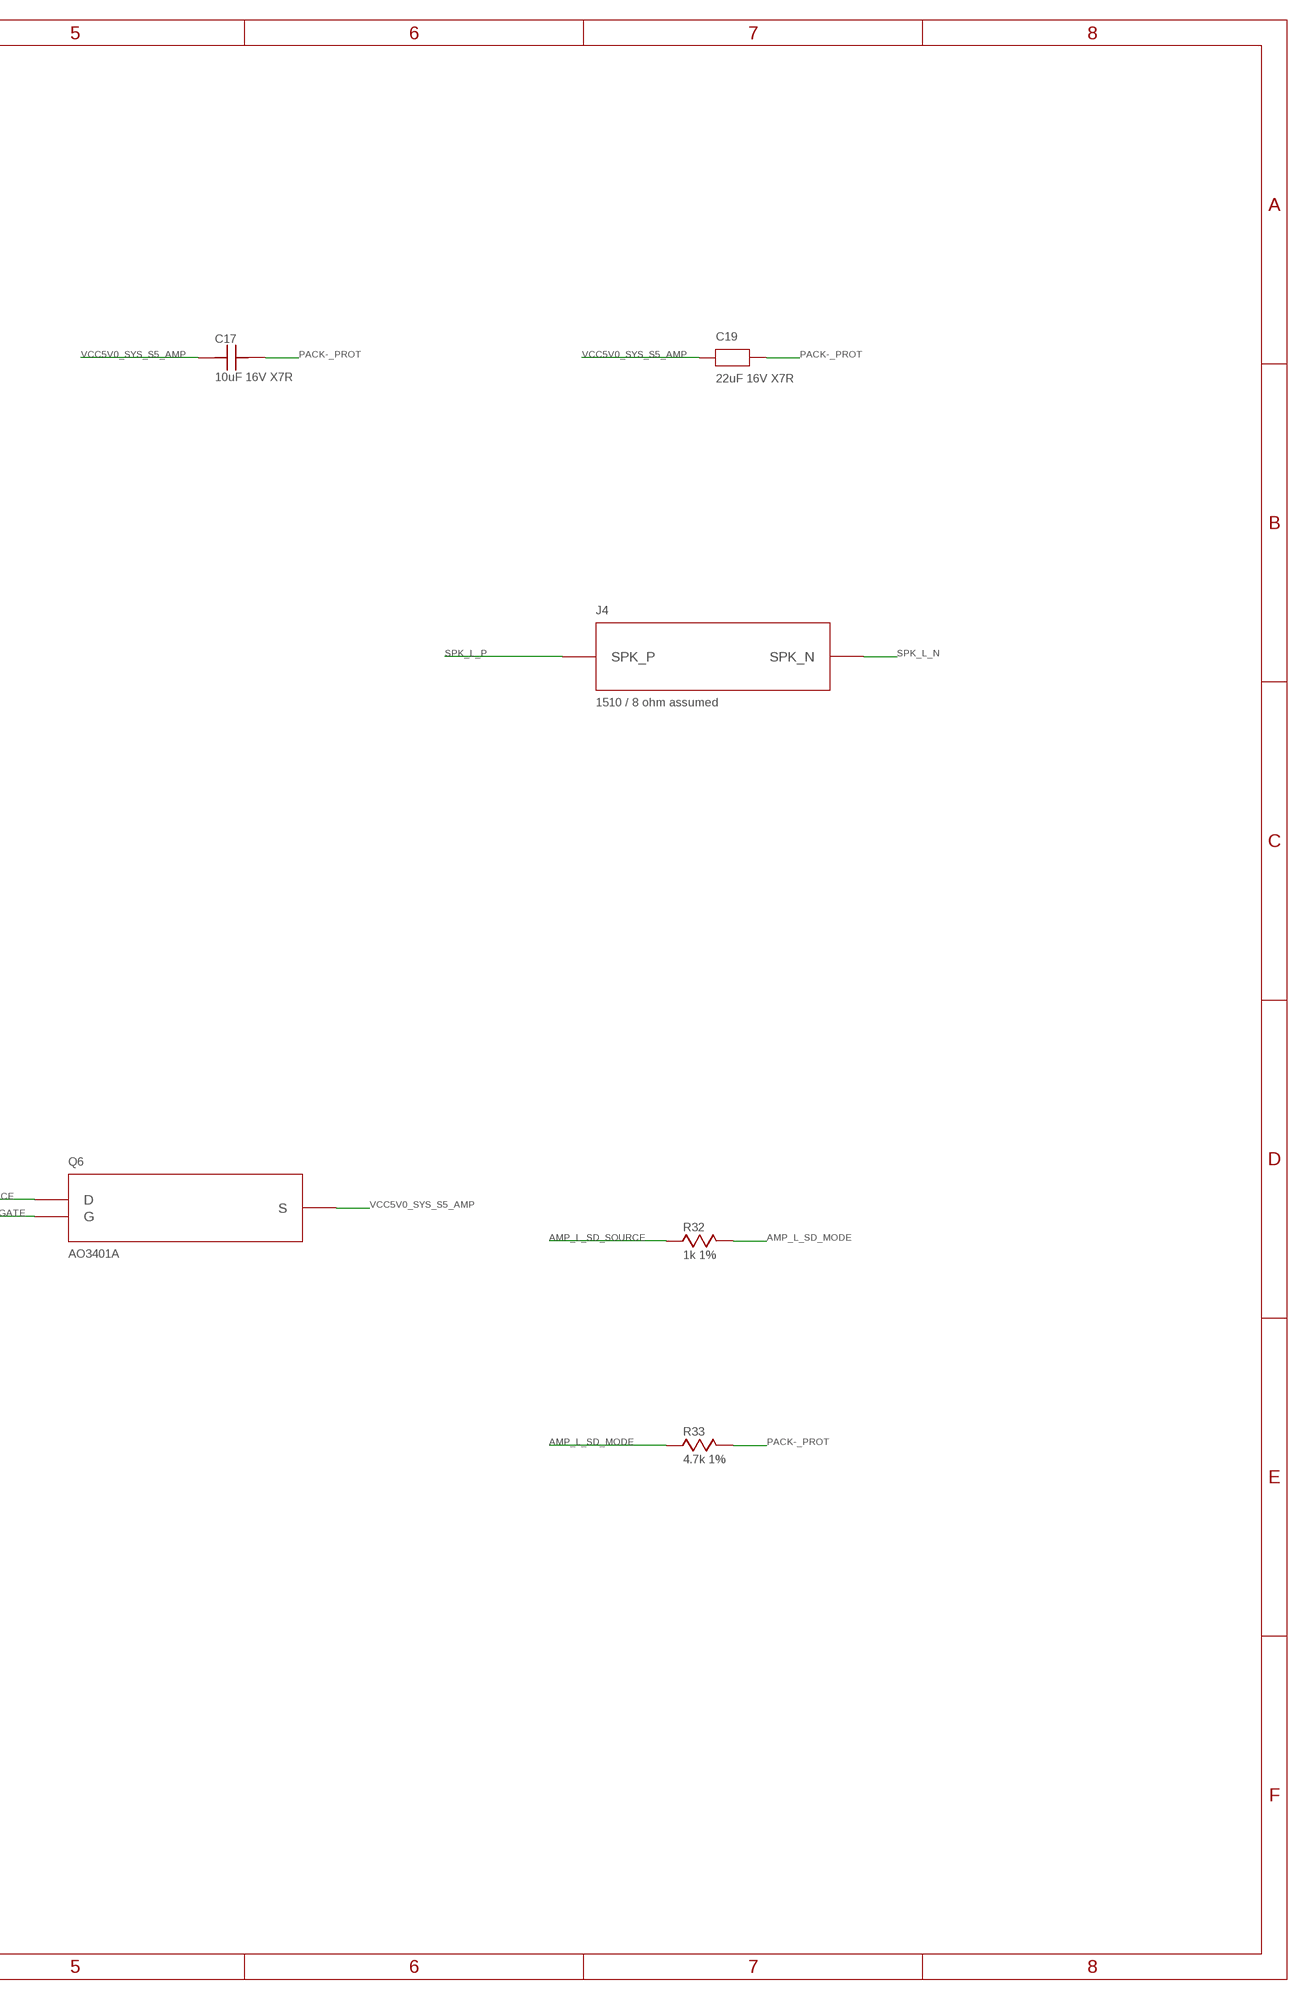
[diagram p8: schematic, sheet 5, part 2 of 2]

### Parts
C16  100nF 16V X7R  C_0603  [C0603]
C17  10uF 16V X7R  C_0805  [C0805]
C18  100nF 16V X7R  C_0603  [C0603]
C19  22uF 16V X7R  C_1206  [C_1206]
J4  1510 / 8 ohm assumed  BTL_SPEAKER  [FRIDAY_SPEAKER_SOLDER_LANDS]
Q6  AO3401A  [SOT23_3]
R29  1k 1%  R_0603  [R0603]
R30  100k 1%  R_0603  [R0603]
R31  100k 1%  R_0603  [R0603]
R32  1k 1%  R_0603  [R0603]
R33  4.7k 1%  R_0603  [R0603]
R34  100k 1%  R_0603  [R0603]
R35  56k 1%  R_0603  [R0603]
R36  10k 1%  R_0603  [R0603]
U5  MAX98357AETE+T  [QFN50P300X300X80-17N]
U6  TLV7041DBVR  TLV7041  [TI_DBV_SOT23_5]

### Nets
AMP_L_ENABLE_GATE: R29.2 R30.1 U6.4(IN-)
AMP_L_GAIN: R34.2 U5.2(GAIN_SLOT)
AMP_L_SD_MODE: R32.2 R33.1 U5.4(SD_MODE)
AMP_L_SD_SOURCE: Q6.3(D) R32.1
AMP_L_SELECT_GATE: Q6.1(G) R31.2 U6.1(OUT)
AMP_L_SELECT_REF: R35.2 R36.1 U6.3(IN+)
PACK-_PROT: C16.2 C17.2 C18.2 C19.2 R30.2 R33.2 R36.2 U5.3(GND) U5.11(GND) U5.15(GND) U5.17(EP) U6.2(GND) ; also sheet 1,2,3,4
SAI1_BCLK_M0: U5.16(BCLK) ; also sheet 4
SAI1_LRCK_M0: U5.14(LRCLK) ; also sheet 4
SAI1_SDO0_M0: U5.1(DIN) ; also sheet 4
SD_MODE_L: R29.1 ; also sheet 4
SPK_L_N: J4.2(SPK_N) U5.10(OUTN)
SPK_L_P: J4.1(SPK_P) U5.9(OUTP)
VCC5V0_SYS_S5_AMP: C16.1 C17.1 C18.1 C19.1 Q6.2(S) R31.1 R34.1 R35.1 U5.7(VDD) U5.8(VDD) U6.5(VCC) ; also sheet 4

### Notes on the sheet
- FRIDAY / SCH-4b / LEFT TEMPLE AUDIO
- J3 pins 2–3 switched 5 V, 5/7/8 SAI1, 9 channel enable
- 0.8 W into assumed 8 ohms is a software and bench limit. GAIN_SLOT is set to +3 dB.
- Local BTL speaker pair. Verify >10 uH voice-coil inductance and emissions.
- Host low or high-Z shuts down. Host high selects the fitted channel through the local rail.

## Library data of the parts
BT1 BT2 = FRIDAY_SCH4a_Power:CELL_TABS
C1 C2 C5 C10-C16 C18 = FRIDAY_SCH1_Support:C_0603
C3 C4 C6-C9 = FRIDAY_SCH4a_Power:C_1206
C17 = FRIDAY_SCH1_Support:C_0805
C19 = FRIDAY_SCH4b_Audio:C_1206
D1 D2 = FRIDAY_SCH4a_Power:SMF_TVS
F1 = FRIDAY_SCH4a_Power:NANO2_FUSE
J1 = FRIDAY_SCH4a_Power:MAGNETIC_POGO
J2 = FRIDAY_SCH4a_Power:HARNESS_PADS
J3 = FH12-24S-0.5SH_55_:FH12-24S-0.5SH(55); DATASHEET_URL: https://s3.amazonaws.com/snapeda/datasheet/FH12-24S-05SH-55-_Hirose.pdf; DESCRIPTION: 24 Position FFC, FPC Connector Contacts, Bottom 0.020" (0.50mm) Surface Mount, Right Angle; MANUFACTURER: Hirose; MAXIMUM_PACKAGE_HEIGHT: 2.2mm; MPN: FH12-24S-0.5SH(55); SOURCE_URL: https://www.snapeda.com/parts/FH12-24S-0.5SH(55)/Hirose+Electric+Co+Ltd/view-part/; STANDARD: Manufacturer recommendations
J4 = FRIDAY_SCH4b_Audio:BTL_SPEAKER
L1 = FRIDAY_SCH4a_Power:INDUCTOR
Q1 = FRIDAY_SCH4b_Audio:SISF04DN
Q2 = FRIDAY_SCH4a_Power:AO3401A
Q3-Q5 = FRIDAY_SCH4a_Power:DMN2058U
Q6 = FRIDAY_SCH4b_Audio:AO3401A
R1-R10 R12-R36 = FRIDAY_SCH1_Support:R_0603
R11 = FRIDAY_SCH4a_Power:R_1206
RS1 = FRIDAY_SCH4a_Power:WSK2512
TH1 = FRIDAY_SCH4a_Power:PACK_NTC
TP1-TP8 = FRIDAY_SCH1_Support:TP_1MM
U1 = FRIDAY_SCH4a_Power:IP2326_NPD
U2 = FRIDAY_SCH4a_Power:HY2120_CB
U3 U4 = FRIDAY_SCH4a_Power:TPS259470
U5 = MAX98357AETE_T:MAX98357AETE+T; DATASHEET_URL: https://s3.amazonaws.com/snapeda/datasheet/MAX98357AETE_T_Maxim_Integrated_Products.pdf; DESCRIPTION: Audio Amp Speaker 1-CH Mono 3.2W Class-D 16-Pin TQFN EP T/R; MANUFACTURER: Analog Devices; MPN: MAX98357AETE+T; Package: TQFN-16 Maxim; SOURCE_URL: https://www.snapeda.com/parts/MAX98357AETE+T/Analog+Devices/view-part/
U6 = FRIDAY_SCH4b_Audio:TLV7041